# Altium project PCB_Project.PrjPcb
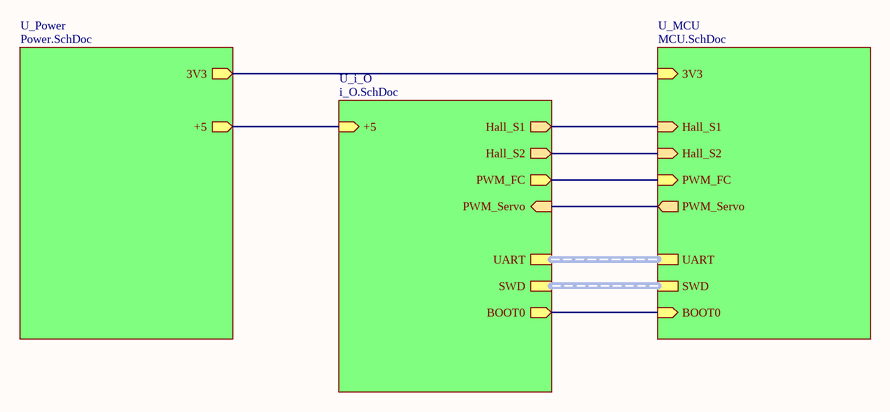
[diagram p0: Main.SchDoc]
4 sheets, 39 parts. Net scope: hierarchical (ports join the sheet entries above them; power ports are global).
Board file: PCB_Dr5x3.PcbDoc
Sheets:
  Main.SchDoc
    U_Power = Power.SchDoc
    U_i_O = i_O.SchDoc
    U_MCU = MCU.SchDoc

## Sheet Main.SchDoc
size A4; SheetNumber: 1; SheetTotal: 4

### Sub-sheets
U_i_O = i_O.SchDoc: PWM_Servo (in), Hall_S1 (out), Hall_S2 (out), BOOT0 (out), UART (harness UART), SWD (harness SWD), +5 (in), PWM_FC (out)
U_MCU = MCU.SchDoc: Hall_S2 (in), Hall_S1 (in), PWM_Servo (out), BOOT0 (in), 3V3 (in), UART (harness UART), SWD (harness SWD), PWM_FC (in)
U_Power = Power.SchDoc: 3V3 (out), +5 (out)

### Nets
3V3: sheet U_Power/3V3, sheet U_MCU/3V3
+5: sheet U_Power/+5, sheet U_i_O/+5
BOOT0: sheet U_i_O/BOOT0, sheet U_MCU/BOOT0
Hall_S1: sheet U_i_O/Hall_S1, sheet U_MCU/Hall_S1
Hall_S2: sheet U_i_O/Hall_S2, sheet U_MCU/Hall_S2
PWM_FC: sheet U_i_O/PWM_FC, sheet U_MCU/PWM_FC
PWM_Servo: sheet U_i_O/PWM_Servo, sheet U_MCU/PWM_Servo

### Buses and harness runs
harness sheet U_i_O/SWD = sheet U_MCU/SWD
harness sheet U_i_O/UART = sheet U_MCU/UART

## Sheet Power.SchDoc
size A4; SheetNumber: 3; SheetTotal: 4
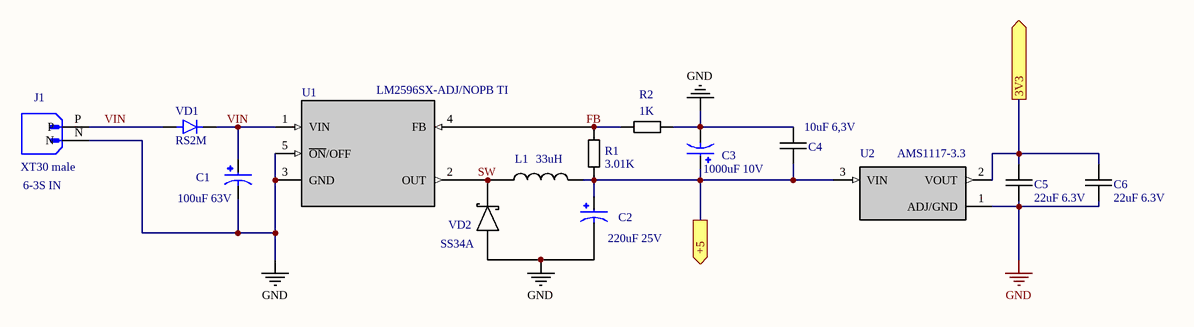
[diagram p1: Power.SchDoc]

### Parts
C1  100uF 63V  [C_POL_D10_P5]
C2  220uF 25V  [C_POL_D8_P3.5]
C3  1000uF 10V  [C_POL_D8_P3.5]
C4  10uF 6,3V  [C_0603]
C5  22uF 6.3V  [C_0603]
C6  22uF 6.3V  [C_0603]
J1  XT30 male  [XT30PW-M]
L1  33uH  [L_SND0705]
R1  3.01K  [R0603]
R2  1K  [R0603]
U1  LM2596SX-ADJ/NOPB TI  [LM2596SX-ADJ/NOPB]
U2  AMS1117-3.3  [LDO_SOT223]
VD1  RS2M  [VD_DO-214AA]
VD2  SS34A  [D_SCH_SS34A]

### Ports
3V3 (out, see Main[2B], MCU[1B]), +5 (out, see Main[2B], i_O[2B])

### Nets
3V3: C5.2 C6.2 U2.2(VOUT) ; port 3V3
GND: C1.N C2.N C3.N C4.2 C5.1 C6.1 J1.N R2.2 U1.3(GND) U1.5(~{ON}/OFF) U2.1(ADJ/GND) VD2.A
+5: C2.P C3.P C4.1 L1.2 R1.1 U2.3(VIN) ; port +5
FB: R1.2 R2.1 U1.4(FB)
SW: L1.1 U1.2(OUT) VD2.K
VIN: C1.P J1.P U1.1(VIN) VD1.A VD1.C(K)

### Notes on the sheet
- (near J1) 6-3S IN

### Library data of the parts
C1 = 100uF 63V EHR 10x13mm: 100uF 63V EHR 10x13mm (EHR101M63B-Hitano)  Electrolytic; MP: EEUFR1J101LB; MF: Hitano; Component Link 1 Description: Datasheet; Package: RADIAL-2 Panasonic; Value: *; SnapEDA_Link: https://www.snapeda.com/parts/EEUFR1J101LB/Panasonic/view-part/?ref=snap; Price: None; Availability: In Stock; Check_prices: https://www.snapeda.com/parts/EEUFR1J101LB/Panasonic/view-part/?ref=eda; Part Number: 100uF 63V EHR 10x13mm; MPN: EHR101M63B-Hitano; Capacitance: 100uF; Voltage: 63V; Category: Electrolytic; Supplier 1: rcscomponents; Supplier Part Number 1: 50458; Supplier Link 1: https://www.rcscomponents.kiev.ua/product/100uf-63v-ehr-10x13mm-ehr101m63b-hitano-elektrolitychnyi-kondensator_50458.html; Component Link 1 URL: https://www.rcscomponents.kiev.ua/datasheets/EHR_081225.pdf
C2 = 220uF 25V RTE 8x11,5mm (low esr): 220uF 25V RTE 8x11,5mm (low esr) (RTE1E221M0812-LEAGUER) Electrolytic; MP: EEUFR1J101LB; Component Link 1 Description: Datasheet; Package: RADIAL-2 Panasonic; Value: *; SnapEDA_Link: https://www.snapeda.com/parts/EEUFR1J101LB/Panasonic/view-part/?ref=snap; Price: None; Availability: In Stock; MF: LEAGUER; Check_prices: https://www.snapeda.com/parts/EEUFR1J101LB/Panasonic/view-part/?ref=eda; Part Number: 220uF 25V RTE 8x11,5mm (low esr); MPN: RTE1E221M0812-LEAGUER; Capacitance: 220uF; Voltage: 25V; ESR: low; Category: Electrolytic; Supplier 1: rcscomponents; Supplier Part Number 1: 180534; Supplier Link 1: https://www.rcscomponents.kiev.ua/product/220uf-25v-rte-8x11-5mm-low-esr-rte1e221m0812-leaguer-elektrolitychnyi-kondensator-nyzkoimpedansnyi_180534.html; Component Link 1 URL: https://www.rcscomponents.kiev.ua/datasheets/leaguer-rte_series-datasheet.pdf
C3 = 1000uF 10V RT1 8x12mm: 1000uF 10V RT1 8x12mm +105°С; MPN: RT11A102M0812; MP: EEUFR1J101LB; MF: Leaguer; Dielectric: electrolit; Component Link 1 Description: Datasheet; Package: RADIAL-2 Panasonic; Value: *; SnapEDA_Link: https://www.snapeda.com/parts/EEUFR1J101LB/Panasonic/view-part/?ref=snap; Price: None; Availability: In Stock; Check_prices: https://www.snapeda.com/parts/EEUFR1J101LB/Panasonic/view-part/?ref=eda; Part Number: 1000uF 10V RT1 8x12mm; Capacitance: 1000uF; Voltage: 10V; Category: Pol electrolit; Supplier 1: rcscomponents; Supplier Part Number 1: 124893; Supplier Link 1: https://www.rcscomponents.kiev.ua/product/1000uf-10v-rt1-8x12mm-rt11a102m0812-leaguer-elektrolitychnyi-kondensator_124893.html; Component Link 1 URL: https://www.rcscomponents.kiev.ua/datasheets/ke47003518x36t-datasheet.pdf
C4 = 10uF 6,3V X5R 20% 0603: MPN: C0603X106M063NT; Voltage: 6.3V; Tolerance: 0.2; MF: Hitano; Component Link 1 Description: Datasheet; Part Number: 10uF 6,3V X5R 20% 0603; Capacitance: 10uF; Dielectric: X5R; Category: Ceramic Capacitor; Supplier 1: rcscomponents; Supplier Part Number 1: 50744; Supplier Link 1: https://www.rcscomponents.kiev.ua/product/10uf-6-3v-x5r-20-0603-4k-reel-c0603x106m063nt-hitano-kondensator-keramichnyi-smd_50744.html; Component Link 1 URL: https://www.rcscomponents.kiev.ua/datasheets/X7R_X5R.pdf
C5 C6 = 22uF 6,3V X5R 20% 0603: MPN: CL10A226MQ8NRNC; Tolerance: 0.2; MF: Samsung; Component Link 1 Description: Datasheet; Part Number: 22uF 6,3V X5R 20% 0603; Capacitance: 22uF; Voltage: 6.3V; Dielectric: X5R; Category: Ceramic Capacitor; Supplier 1: rcscomponents; Supplier Part Number 1: 128028; Supplier Link 1: https://www.rcscomponents.kiev.ua/product/22uf-6-3v-x5r-20-0603-cl10a226mq8nrnc-samsung_128028.html; Component Link 1 URL: https://www.rcscomponents.kiev.ua/datasheets/cl_series_mlcc_datasheet.pdf
J1 = XT30PW-M: Socket; DC supply; XT30; male; PIN: 2; on PCBs; THT; Colour: yellow; MF: AMASS; SnapEDA_Link: https://www.snapeda.com/parts/XT30PW-M/AMASS/view-part/?ref=snap; Package: None; Value: *; MP: XT30PW-M; Check_prices: https://www.snapeda.com/parts/XT30PW-M/AMASS/view-part/?ref=eda; Part Number: XT30PW-M; MPN: XT30PW-M; Supplier 1: IMRAD; Supplier Part Number 1: 395565; Supplier Link 1: https://imrad.com.ua/ru/xt30pw-m
L1 = 33uH, ±20%, 1.2A, 0.13 Ohm: SND0705-330M (33uH, ±20%, 1.2A, 0.13 Ohm, SMD: 7.8x7.0mm, h=5.0mm) Anla Tech; MP: B82472P6472M000; MF: AnlaTech/IH; Inductance: 33 µH; DCR: 0.13 Ω; Component Link 1 Description: Datasheet; Price: None; Value: *; Package: None; Purchase-URL: https://pricing.snapeda.com/search/part/B82472P6472M000/?ref=eda; SnapEDA_Link: https://www.snapeda.com/parts/B82472P6472M000/TDK/view-part/?ref=snap; Check_prices: https://www.snapeda.com/parts/B82472P6472M000/TDK/view-part/?ref=eda; Availability: In Stock; Part Number: 33uH, ±20%, 1.2A, 0.13 Ohm; MPN: SND0705-330M; Current: 1.2A; Tolerance: ±20%; Category: Power Inductor; Supplier 1: rcscomponents; Supplier Part Number 1: 39225; Supplier Link 1: https://www.rcscomponents.kiev.ua/product/snd0705-330m-33uh-20-1-2a-0-13-ohm-smd-7-8x7-0mm-h-5-0mm-anla-tech-drosel-sylovyi_39225.html; Component Link 1 URL: https://www.rcscomponents.kiev.ua/datasheets/SND-1.pdf
R1 = R0603 3.01K 1% 0.1W: R0603 3.01K 1% 0.1W Hitano; MPN: RC0603FR-3K01R; Tolerance: 0.01; Voltage: 50V; TCR: ±100 ppm/°C; Component Link 1 Description: Datasheet; Part Number: R0603 3.01K 1% 0.1W; Resistance: 3.01K; Power: 0.1W; Category: Thick Film Resistor; MF: Hitano; Supplier 1: rcscomponents; Supplier Part Number 1: 27651; Supplier Link 1: https://www.rcscomponents.kiev.ua/product/3-01-kohm-1-0-1w-50v-0603-rc0603fr-3k01r-hitano-rezystor-smd_27651.html; Component Link 1 URL: https://www.rcscomponents.kiev.ua/datasheets/RC0603HIT.pdf
R2 = R0603 1K 1% 0.1W: R0603 1K 1% 0.1W YAGEO; MPN: RC0603FR-071KL; Power: 1/10W; Tolerance: 0.01; Voltage: 75V; TCR: ±100 ppm/°C; Component Link 1 Description: Datasheet; Part Number: R0603 1K 1% 0.1W; Resistance: 1k; Category: Thick Film Resistor; MF: YAGEO; Supplier 1: rcscomponents; Supplier Part Number 1: 182684; Supplier Link 1: https://www.rcscomponents.kiev.ua/product/1-kohm-1-0-1w-75v-0603-rc0603fr-071kl-yageo-rezystor-smd_182684.html; Component Link 1 URL: https://www.rcscomponents.kiev.ua/datasheets/rc0603-272842.pdf
U1 = LM2596SX-ADJ/NOPB: DC/DC Buck Converter IC; MF: Texas Instruments; VIN: 4.5–40V; VOUT: 1.23–37 V, Adjustable; IOUT: 3A; Frequency: 150 kHz; Component Link 1 Description: Datasheet; SnapEDA_Link: https://www.snapeda.com/parts/LM2596SX-ADJ/NOPB/Texas+Instruments/view-part/?ref=snap; Package: TO-263-5 Texas Instruments; Value: *; MP: LM2596SX-ADJ/NOPB; Check_prices: https://www.snapeda.com/parts/LM2596SX-ADJ/NOPB/Texas+Instruments/view-part/?ref=eda; Part Number: LM2596SX-ADJ/NOPB; MPN: LM2596SX-ADJ/NOPB; Type: Adjustable; Category: Buck Converter (SMD); Supplier 1: rcscomponents; Supplier Part Number 1: 61180; Supplier Link 1: https://www.rcscomponents.kiev.ua/product/lm2596sx-adj-nopb_61180.html; Component Link 1 URL: https://www.ti.com/general/docs/suppproductinfo.tsp?distId=10&gotoUrl=http%3A%2F%2Fwww.ti.com%2Flit%2Fgpn%2Flm2596
U2 = LDO_SOT223_3V3: Linear Voltage Regulator IC Positive Fixed 1 Output 1A SOT-223-3L; MF: Multiple; VOUT: 3.3V; VIN (Max): 15V; Dropout: 1.1V; Component Link 1 Description: Datasheet; SnapEDA_Link: https://www.snapeda.com/parts/AMS1117-3.3/UMW/view-part/?ref=snap; Package: SOT-223-3L UMW; Value: *; MP: AMS1117-3.3; Check_prices: https://www.snapeda.com/parts/AMS1117-3.3/UMW/view-part/?ref=eda; Part Number: LDO_SOT223_3V3; MPN: AMS1117-3.3; IOUT: 1A; Output Type: Fixed; Category: LDO Regulator (SMD); Supplier 1: rcscomponents; Supplier Part Number 1: 87031; Supplier Link 1: https://www.rcscomponents.kiev.ua/product/ams1117-3-3_87031.html; Component Link 1 URL: https://mm.digikey.com/Volume0/opasdata/d220001/medias/docus/7158/5272_AMS1117-3.3.pdf
VD1 = RS2M MIC: Vf 1.3 / I2A / 1000V; MF: MIC; IF: 2A; VF: 1.3V; Component Link 1 Description: Datasheet; Package: DO-214AA-2 Taiwan Semiconductor; Price: None; Value: *; SnapEDA_Link: https://www.snapeda.com/parts/RS2M/Taiwan+Semiconductor/view-part/?ref=snap; MP: RS2M; Availability: In Stock; Check_prices: https://www.snapeda.com/parts/RS2M/Taiwan+Semiconductor/view-part/?ref=eda; Part Number: RS2M MIC; MPN: RS2M MIC; VRRM: 1000V; Category: Diode; Supplier 1: rcscomponents; Supplier Part Number 1: 182600; Supplier Link 1: https://www.rcscomponents.kiev.ua/product/rs2m_182600.html; Component Link 1 URL: https://www.rcscomponents.kiev.ua/product/rs2m_182600.html
VD2 = SS34A: Vrrm 40V / If 3А / Vf0,5V / Ifsm80A; IF: 3A; VF: 0.5V; IFSM: 80A; MF: Hottech; Component Link 1 Description: Datasheet; Part Number: SS34A; MPN: SS34A; VRRM: 40V; Category: Schottky Diode; Supplier 1: rcscomponents; Supplier Part Number 1: 199953; Supplier Link 1: https://www.rcscomponents.kiev.ua/product/ss34a_199953.html; Component Link 1 URL: https://www.rcscomponents.kiev.ua/datasheets/2204281430_Guangdong-Hottech-SS34A_C2886580.pdf

## Sheet i_O.SchDoc
size A4; SheetNumber: 2; SheetTotal: 4
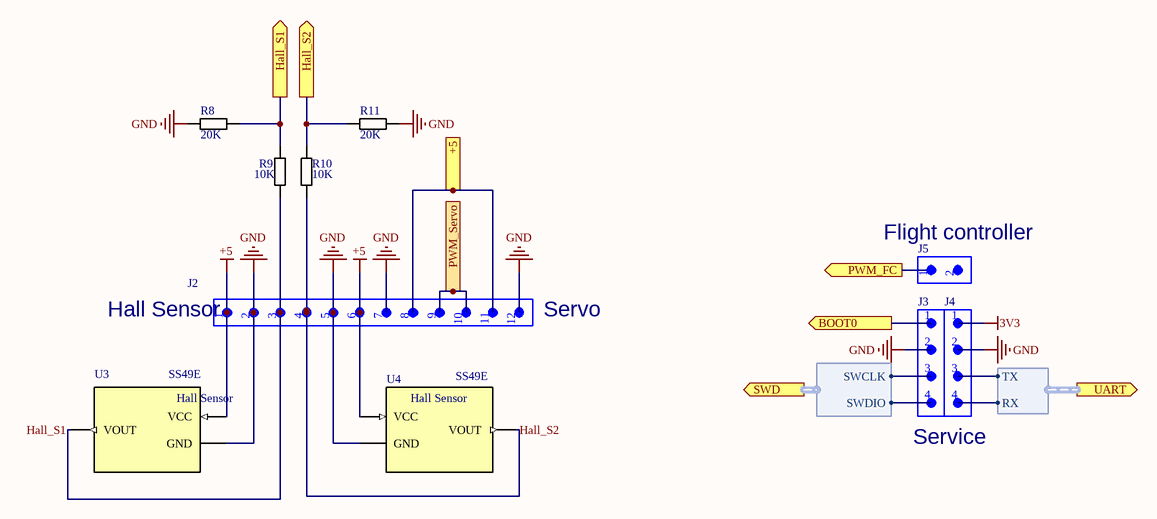
[diagram p2: i_O.SchDoc]

### Parts
J2  Pin_12_Header  [pin_h_12_p2,54mm]  (value not drawn)
J3  Pin_4_Header  [pin_h_4_p2,54mm]  (value not drawn)
J4  Pin_4_Header  [pin_h_4_p2,54mm]  (value not drawn)
J5  2 pin header  [pin_h_2_p2,54mm]  (value not drawn)
R8  20K  [R0603]
R9  10K  [R0603]
R10  10K  [R0603]
R11  20K  [R0603]
U3  SS49E  [SS49E]
U4  SS49E  [SS49E]

### Ports
+5 (in, see Main[2B], Power[3C]), BOOT0 (out, see Main[3C], MCU[2A]), Hall_S1 (out, see Main[3B], MCU[2C]), Hall_S2 (out, see Main[3B], MCU[2C]), PWM_FC (out, see Main[3C], MCU[2C]), PWM_Servo (in, see Main[3C], MCU[2C]), SWD (out, harness SWD, see Main[3C], MCU[3B]), UART (out, harness UART, see Main[3C], MCU[3B])

### Harnesses
UART: RX, TX
SWD: SWDIO, SWCLK

### Nets
3V3: J4.1
+5: J2.1 J2.6 U3.1(VCC) U4.1(VCC)
GND: J2.2 J2.5 J2.7 J2.12 J3.2 J4.2 R8.1 R11.1 U3.2(GND) U4.2(GND)
+5: J2.8 J2.11 ; port +5  [a separate net that carries the same name]
BOOT0: J3.1 ; port BOOT0
Hall_S1: J2.3 R9.1 U3.3(VOUT)
Hall_S1: R8.2 R9.2 ; port Hall_S1  [a separate net that carries the same name]
Hall_S2: J2.4 R10.1 U4.3(VOUT)
Hall_S2: R10.2 R11.2 ; port Hall_S2  [a separate net that carries the same name]
PWM_FC: J5.1 ; port PWM_FC
PWM_Servo: J2.9 J2.10 ; port PWM_Servo
NetJ3_3: J3.3 ; port SWD.SWCLK
NetJ3_4: J3.4 ; port SWD.SWDIO
NetJ4_3: J4.3 ; port UART.TX
NetJ4_4: J4.4 ; port UART.RX

Not connected (* = marked no-connect by the designer): J5 2

### Notes on the sheet
- (near J5) Flight controller
- (near J2) Hall Sensor
- (near J2) Servo
- Service
- (in symbol SS49E) Hall Sensor

### Library data of the parts
J5 = 2 pin header: p.2,54mm; Part Number: 2 pin header; MPN: 2 pin header; Supplier 1: Arduino UA; Supplier Part Number 1: SKV114; Supplier Link 1: https://arduino.ua/ru/prod332-konnektor-40-pin-papa
R8 R11 = R0603 20 kOhm 1% 0,1W 50V: 20 kOhm 1% 0,1W 50V; MPN: RC0603FR-20KR; Power: 0.1W; Tolerance: 0.01; MF: Hitano; Component Link 1 Description: Datasheet; Part Number: R0603 20 kOhm 1% 0,1W 50V; Resistance: 20K; Voltage: 50V; Category: Thick Film Resistor; Supplier 1: rcscomponents; Supplier Part Number 1: 16748; Supplier Link 1: https://www.rcscomponents.kiev.ua/product/20-kohm-1-0-1w-50v-0603-rc0603fr-20kr-hitano-rezystor-smd_16748.html; Component Link 1 URL: https://www.rcscomponents.kiev.ua/datasheets/rc_series_hitano-datasheet.pdf
R9 R10 = R0603 10K 5% 0.1W: 10 kOhm 5% 0,1W 50V; MPN: RC0603JR-0710KL; Power: 0.1W; Tolerance: 0.05; MF: Yageo; Component Link 1 Description: Datasheet; Part Number: R0603 10K 5% 0.1W; Resistance: 10K; Voltage: 50V; Category: Thick Film Resistor; Supplier 1: rcscomponents; Supplier Part Number 1: 107096; Supplier Link 1: https://www.rcscomponents.kiev.ua/product/10-kohm-5-0-1w-50v-0603-rc0603jr-0710kl-yageo_107096.html
U3 = SS49E: TO92; MF: Honeywell; Component Link 1 Description: Datasheet; Supply Voltage: 4.5–6.0 V; Output Voltage: 0.2–4.8 V; Sensitivity: 1.0 mV/G typ.; MPN: SS49E; Supplier 1: Arduino.ua; Supplier Part Number 1: DAT189; Supplier Link 1: https://arduino.ua/ru/prod1474-datchik-holla-ss49e; Component Link 1 URL: https://content.instructables.com/ORIG/FHV/BQO4/JVR5YV9R/FHVBQO4JVR5YV9R.pdf; Part Number: SS49E; Type: Analog
U4 = SS49E: TO92; Supply Voltage: 4.5–6.0 V; Output Voltage: 0.2–4.8 V; Sensitivity: 1.0 mV/G typ.; MF: Honeywell; Component Link 1 Description: Datasheet; Part Number: SS49E; MPN: SS49E; Type: Analog; Supplier 1: Arduino.ua; Supplier Part Number 1: DAT189; Supplier Link 1: https://arduino.ua/ru/prod1474-datchik-holla-ss49e; Component Link 1 URL: https://content.instructables.com/ORIG/FHV/BQO4/JVR5YV9R/FHVBQO4JVR5YV9R.pdf

## Sheet MCU.SchDoc
size A4; SheetNumber: 4; SheetTotal: 4
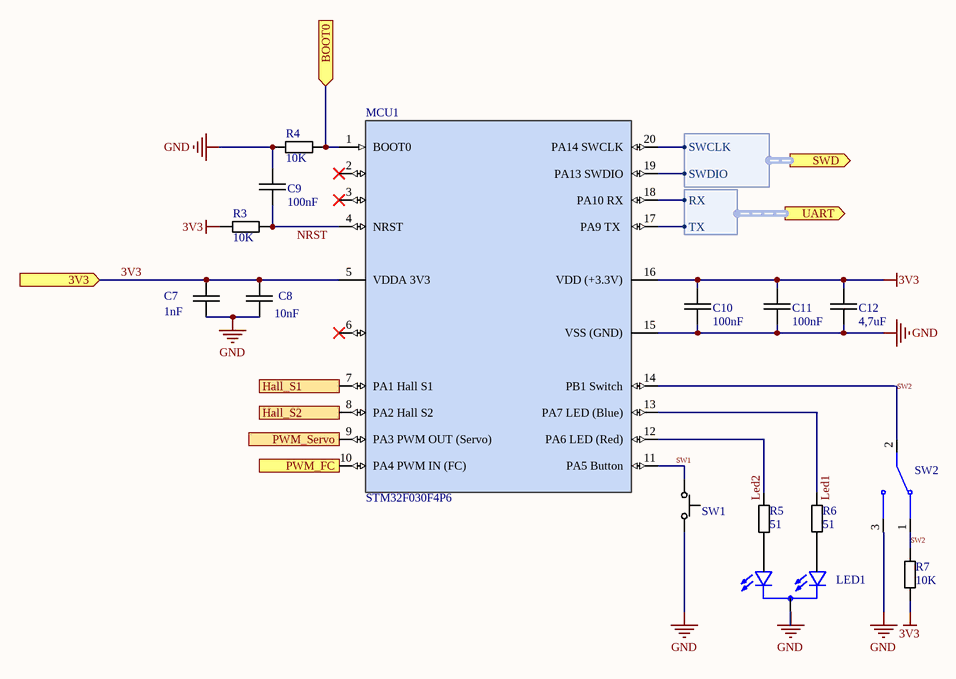
[diagram p3: MCU.SchDoc]

### Parts
C7  1nF  [C_0603]
C8  10nF  [C_0603]
C9  100nF  [C_0603]
C10  100nF  [C_0603]
C11  100nF  [C_0603]
C12  4,7uF  [C_0603]
LED1  Led GB  [led_5mm_3pin]  (value not drawn)
MCU1  STM32F030F4P6  [TSSOP-20]
R3  10K  [R0603]
R4  10K  [R0603]
R5  51  [R0603]
R6  51  [R0603]
R7  10K  [R0603]
SW1  4,5x4,5, H7mm,  [button_SPST_NO]  (value not drawn)
SW2  button_slide_switch_2  [button_slide_switch_2]  (value not drawn)

### Ports
3V3 (in, see Main[3B], Power[4B]), BOOT0 (in, see Main[3C], i_O[3B]), Hall_S1 (in, see Main[3B], i_O[2B]), Hall_S2 (in, see Main[3B], i_O[2B]), PWM_FC (in, see Main[3C], i_O[3B]), PWM_Servo (out, see Main[3C], i_O[2B]), SWD (out, harness SWD, see Main[3C], i_O[3C]), UART (out, harness UART, see Main[3C], i_O[4C])

### Harnesses
UART: RX, TX
SWD: SWDIO, SWCLK

### Nets
3V3: C7.1 C8.2 C10.2 C11.2 C12.2 MCU1.5(VDDA_3V3) MCU1.16(VDD_(+3.3V)) R3.1 R7.2 ; port 3V3
GND: C7.2 C8.1 C9.2 C10.1 C11.1 C12.1 LED1.2(COMMON_CATHODE) MCU1.15(VSS_(GND)) R4.1 SW1.B SW2.3
BOOT0: MCU1.1(BOOT0) R4.2 ; port BOOT0
Hall_S1: MCU1.7(PA1_Hall_S1) ; port Hall_S1
Hall_S2: MCU1.8(PA2_Hall_S2) ; port Hall_S2
Led1: MCU1.13(PA7_LED_(Blue)) R6.1
Led2: MCU1.12(PA6_LED_(Red)) R5.1
NRST: C9.1 MCU1.4(NRST) R3.2
PWM_FC: MCU1.10(PA4_PWM_IN_(FC)) ; port PWM_FC
PWM_Servo: MCU1.9(PA3_PWM_OUT_(Servo)) ; port PWM_Servo
SW1: MCU1.11(PA5_Button) SW1.A
SW2: MCU1.14(PB1_Switch) R7.1 SW2.1 SW2.2
NetJ3_3: MCU1.20(PA14_SWCLK) ; port SWD.SWCLK
NetJ3_4: MCU1.19(PA13_SWDIO) ; port SWD.SWDIO
NetJ4_3: MCU1.17(PA9_TX) ; port UART.TX
NetJ4_4: MCU1.18(PA10_RX) ; port UART.RX
NetLED1_1: LED1.1(ANODE_GREEN) R6.2
NetLED1_3: LED1.3(ANODE_BLUE) R5.2

Not connected (* = marked no-connect by the designer): MCU1 2(PF0/OSC_IN)* 3(PF1/OSC_OUT)* 6(PA0_)*

### Library data of the parts
C7 = 1nF 50V X7R 5% 0603: 1nF 50V X7R 5% 0603 4k/reel (C0603B102J500NT-Hitano); Tolerance: 0.05; MF: Hitano; Component Link 1 Description: Datasheet; Part Number: 1nF 50V X7R 5% 0603; MPN: C0603B102J500NT; Capacitance: 1nF; Voltage: 50V; Dielectric: X7R; Category: Ceramic Capacitor; Supplier 1: rcscomponents; Supplier Part Number 1: 3303; Supplier Link 1: https://www.rcscomponents.kiev.ua/product/1nf-50v-x7r-5-0603-4k-reel-c0603b102j500nt-hitano-kondensator-keramichnyi-smd_3303.html; Component Link 1 URL: https://www.rcscomponents.kiev.ua/datasheets/X7R_X5R.pdf
C8 = 10nF 50V X7R 10% 0603: 10nF 50V X7R 10% 0603 (CL10B103KB8NNNC-Samsung); Tolerance: 0.1; Component Link 1 Description: Datasheet; Part Number: 10nF 50V X7R 10% 0603; MPN: CL10B103KB8NNNC; Capacitance: 10nF; Voltage: 50V; Dielectric: X7R; Category: Ceramic Capacitor; MF: Samsung; Supplier 1: rcscomponents; Supplier Part Number 1: 34908; Supplier Link 1: https://www.rcscomponents.kiev.ua/product/10nf-50v-x7r-10-0603-cl10b103kb8nnnc-samsung-kondensator-keramichnyi-smd_34908.html; Component Link 1 URL: https://www.rcscomponents.kiev.ua/datasheets/cl_series_mlcc_datasheet.pdf
C9-C11 = 100nF 16V X7R 5% 0603: 100nF 16V X7R 5% 0603 (CL10B104JO8NNNC – Samsung); Tolerance: 0.05; Component Link 1 Description: Datasheet; Part Number: 100nF 16V X7R 5% 0603; MPN: CL10B104JO8NNNC; Capacitance: 100nF; Voltage: 16V; Dielectric: X7R; Category: Ceramic Capacitor; MF: Samsung; Supplier 1: rcscomponents; Supplier Part Number 1: 153351; Supplier Link 1: https://www.rcscomponents.kiev.ua/product/100nf-16v-x7r-5-0603-cl10b104jo8nnnc-samsung_153351.html; Component Link 1 URL: https://www.rcscomponents.kiev.ua/datasheets/cl_series_mlcc_datasheet.pdf
C12 = 4,7uF 6,3V X5R 10% 0603: 4,7uF 6,3V X5R 10% 0603 (CL10A475KQ8NNNC-Samsung); Voltage: 6.3V; Tolerance: 0.1; Component Link 1 Description: Datasheet; Part Number: 4,7uF 6,3V X5R 10% 0603; MPN: CL10A475KQ8NNNC; Capacitance: 4,7uF; Dielectric: X5R; Category: Ceramic Capacitor; MF: Samsung; Supplier 1: rcscomponents; Supplier Part Number 1: 50674; Supplier Link 1: https://www.rcscomponents.kiev.ua/product/4-7uf-6-3v-x5r-10-0603-cl10a475kq8nnnc-samsung_50674.html; Component Link 1 URL: https://www.rcscomponents.kiev.ua/datasheets/cl_series_mlcc_datasheet.pdf
LED1 = NPN328: Led 5mm Green Blue СС; Part Number: NPN328; MF: Vishay; MP: TLUV5300; VRRM: 3-3.2V; IF: 0.020A; SnapEDA_Link: https://www.snapeda.com/parts/TLUV5300/Vishay%20Semiconductor%20Opto%20Division/view-part/233523/?ref=snap; Price: None; Package: Radial Vishay; Availability: Unavailable; Value: *; MPN: NPN328; Category: Led; Supplier 1: Arduino.ua; Supplier Part Number 1: NPN328; Supplier Link 1: https://arduino.ua/ru/prod6409-svitlodiod-dvokolirnii-prozorii-3mm-katod-sinii-zelenii
MCU1 = TSSOP-20: MCU; MF: STMicroelectronics; Core: ARM Cortex-M0; CPU Frequency: 48 MHz; Flash: 16 KB; RAM: 4 KB; ADC: 12-bit; GPIO: 15; Operating Voltage: 2.4–3.6 V; Component Link 1 Description: Datasheet; SnapEDA_Link: https://www.snapeda.com/parts/STM32F030F4P6/STMicroelectronics/view-part/?ref=snap; Package: TSSOP-20; Value: *; MP: STM32F030F4P6; Check_prices: https://www.snapeda.com/parts/STM32F030F4P6/STMicroelectronics/view-part/?ref=eda; Part Number: TSSOP-20; MPN: STM32F030F4P6; Supplier 1: rcscomponents; Supplier Part Number 1: 68666; Supplier Link 1: https://www.rcscomponents.kiev.ua/product/stm32f030f4p6_68666.html; Component Link 1 URL: https://www.rcscomponents.kiev.ua/datasheets/dm00088500-datasheet.pdf
R3 R4 R7 = R0603 10K 5% 0.1W: as R9 on sheet i_O; Part Number: R0603 10K 5% 0.1W; Resistance: 10K; Voltage: 50V; Category: Thick Film Resistor; Supplier 1: rcscomponents; Supplier Part Number 1: 107096; Supplier Link 1: https://www.rcscomponents.kiev.ua/product/10-kohm-5-0-1w-50v-0603-rc0603jr-0710kl-yageo_107096.html
R5 R6 = 51 Ohm 5% 0,1W 50V 0603: MPN: RC0603JR-51R; Resistance: 51 Ohm; Power: 0.1W; Tolerance: 0.05; MF: Hitano; Component Link 1 Description: Datasheet; Part Number: 51 Ohm 5% 0,1W 50V 0603; Voltage: 50V; Category: Thick Film Resistor; Supplier 1: rcscomponents; Supplier Part Number 1: 4627; Supplier Link 1: https://www.rcscomponents.kiev.ua/product/51-ohm-5-0-1w-50v-0603-rc0603jr-51r-hitano-rezystor-smd_4627.html; Component Link 1 URL: https://www.rcscomponents.kiev.ua/datasheets/rc_series_hitano-datasheet.pdf
SW1 = SPST-NO: MPN: KFC-045P3-7.0; Param 1 (Value): 0,98N.; Param 3 (Tolerance): 12VDC/50mA; Param 4 (Category): Tact button corner THT; MF: Daier; Param 2 (Power): 4,5x4,5, H7mm; Supplier 1: rcscomponents.; Supplier Part Number 1: 209769; Supplier Link 1: https://www.rcscomponents.kiev.ua/product/knopka-taktova-kutova-4-5x4-5-h7mm-kfc-045p3-7-0_209769.html; Part Number: SPST-NO
SW2 = button_slide_switch_2: 8x6,9x4,3; MPN: SK-12D11-VG3 KLS; MF: TE Connectivity; MP: STS121RA04; Component Link 1 Description: Datasheet; SnapEDA_Link: https://www.snapeda.com/parts/STS121RA04/TE+Connectivity+ALCOSWITCH+Switches/view-part/?ref=snap; Package: None; Value: *; Check_prices: https://www.snapeda.com/parts/STS121RA04/TE+Connectivity+ALCOSWITCH+Switches/view-part/?ref=eda; Part Number: button_slide_switch_2; Supplier 1: rcscomponents148265; Supplier Link 1: https://www.rcscomponents.kiev.ua/product/peremykach-rushiinyi-sk-12d11-vg3_148265.html; Component Link 1 URL: https://www.rcscomponents.kiev.ua/datasheets/sk-12d11-vg3.pdf; Supplier Part Number 1: 148265

## Nets that join several sheets
3V3: Power (C5.2 C6.2 U2.2), i_O (J4.1), MCU (9 pins)
GND: Power (12 pins), i_O (10 pins), MCU (11 pins)
+5: Power (6 pins), i_O (J2.8 J2.11)
BOOT0: i_O (J3.1), MCU (MCU1.1 R4.2)
Hall_S1: i_O (R8.2 R9.2), MCU (MCU1.7)
Hall_S2: i_O (R10.2 R11.2), MCU (MCU1.8)
NetJ3_3: i_O (J3.3), MCU (MCU1.20)
NetJ3_4: i_O (J3.4), MCU (MCU1.19)
NetJ4_3: i_O (J4.3), MCU (MCU1.17)
NetJ4_4: i_O (J4.4), MCU (MCU1.18)
PWM_FC: i_O (J5.1), MCU (MCU1.10)
PWM_Servo: i_O (J2.9 J2.10), MCU (MCU1.9)